# EasyEDA Pro project Programmable Gain Amplifier.eprj

# Schematic Schematic1
Board Name: Board1; Create Date: 2026-07-07; Page Name: P1; Project Name: Programmable Gain Amplifier; Schematic Name: Schematic1; Update Date: 2026-07-08; Company: 嘉立创EDA; Page Size: A4; Version: V1.0
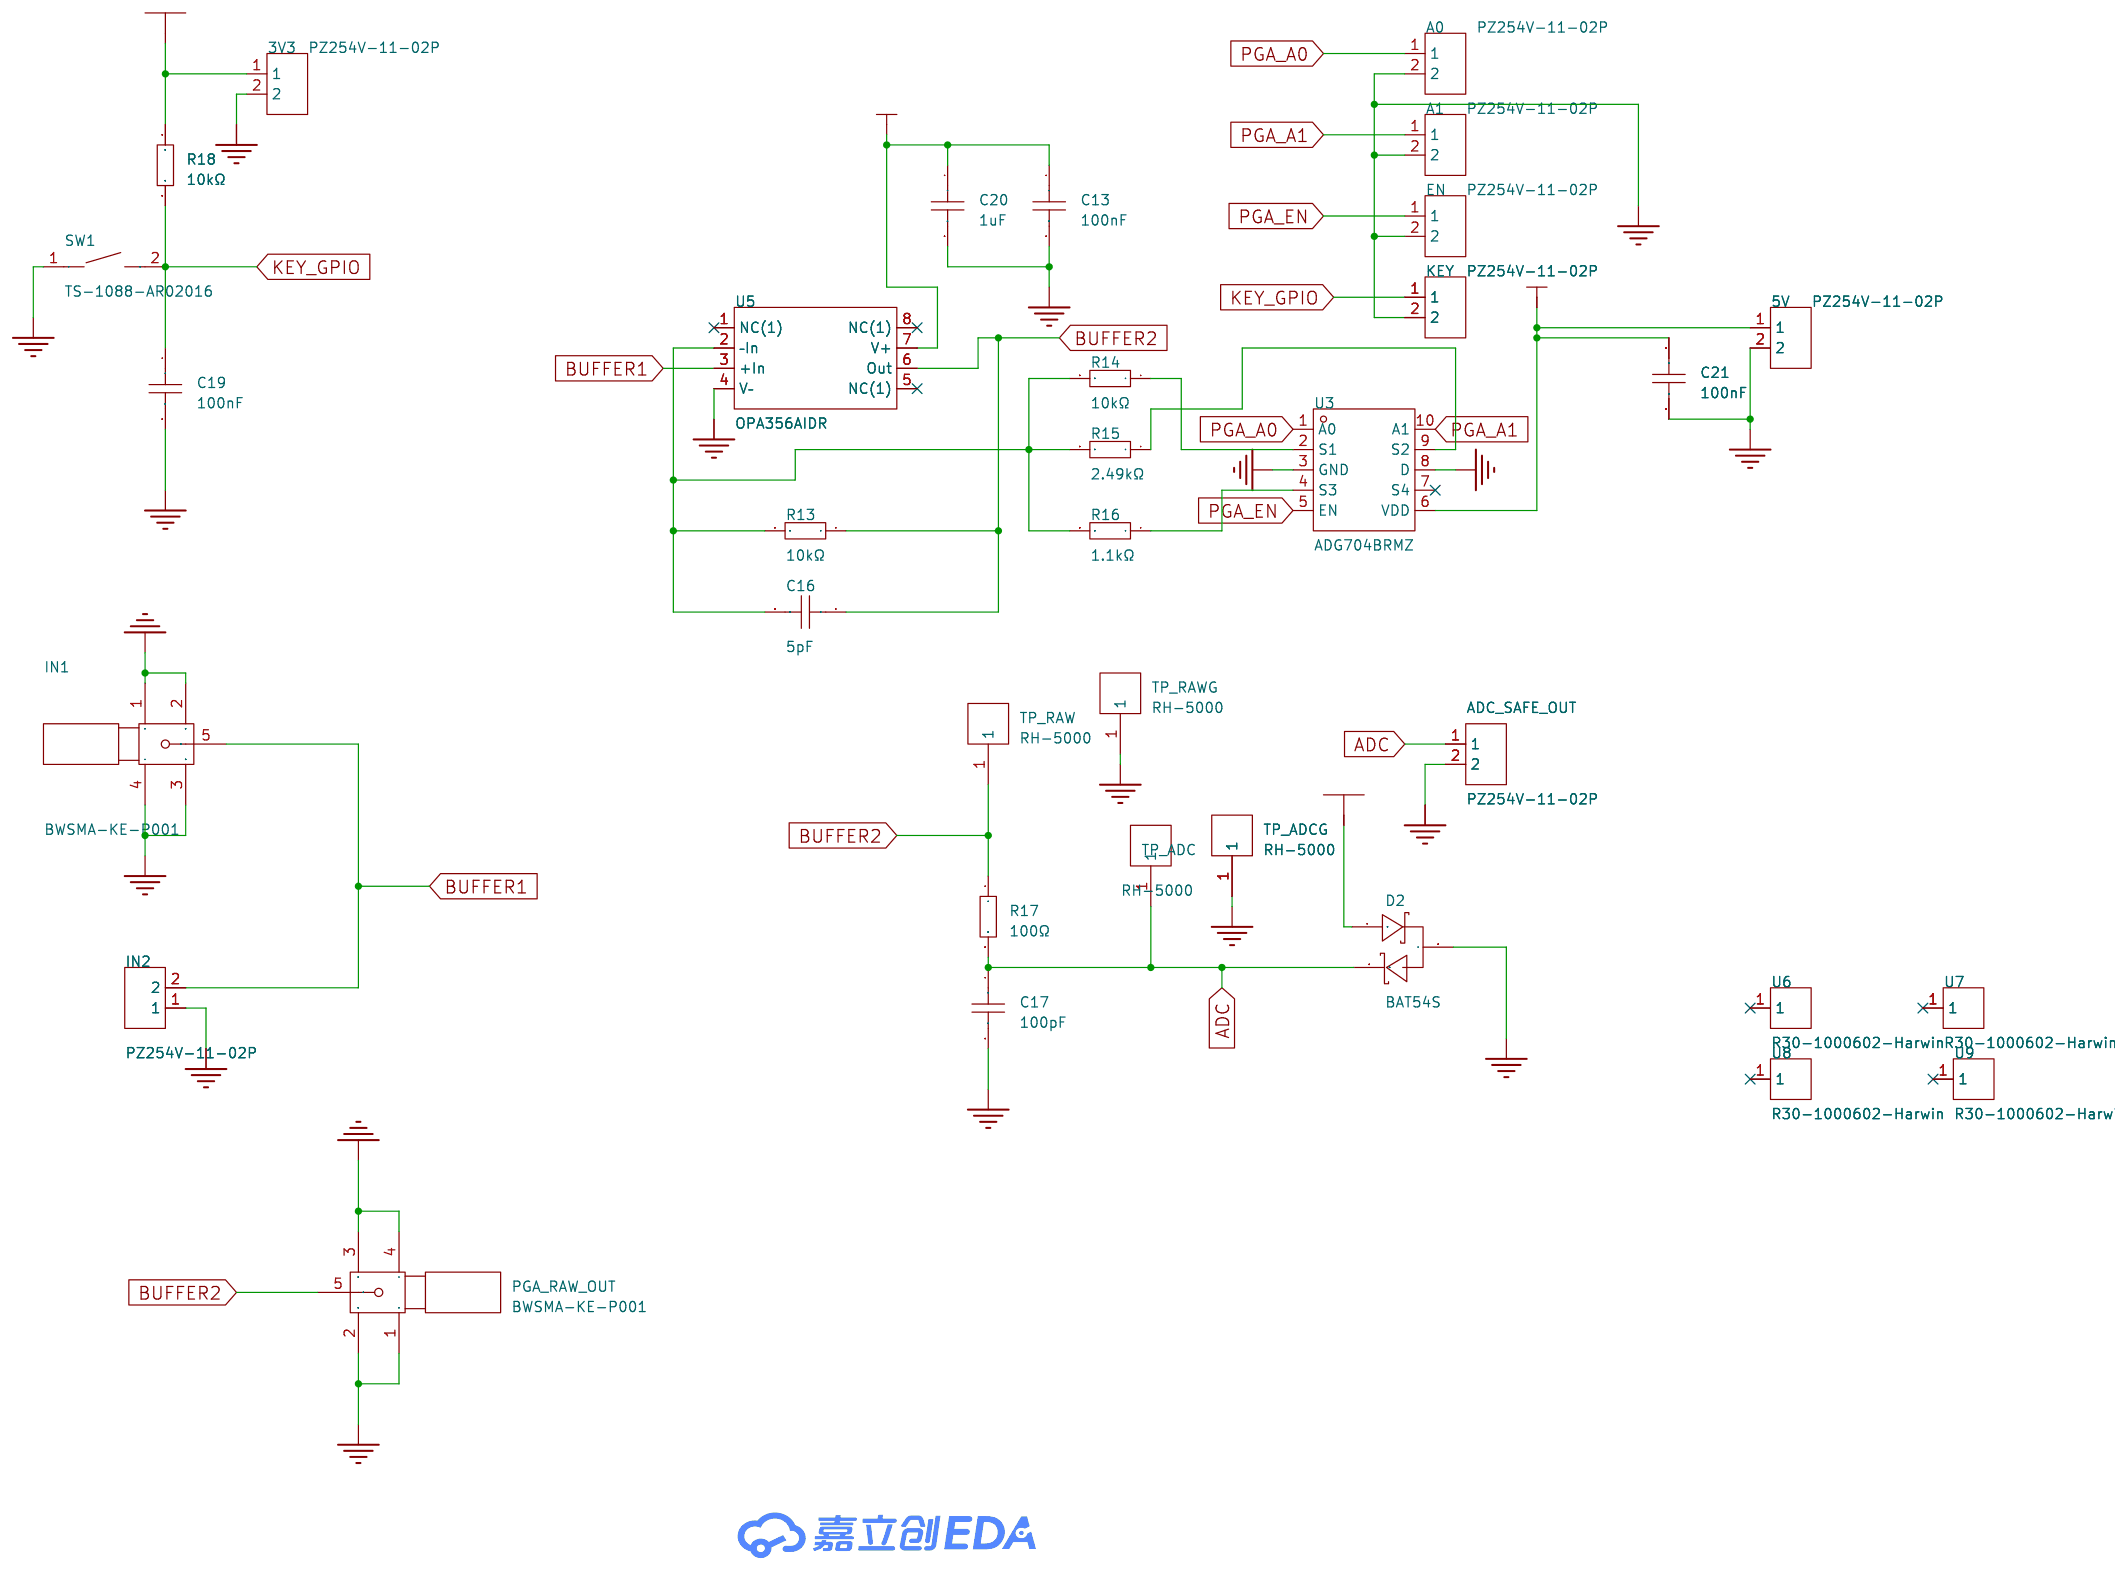
[diagram p0: schematic sheet]

## Parts
3V3  PZ254V-11-02P  [HDR-TH_2P-P2.54-V-M]
5V  PZ254V-11-02P  [HDR-TH_2P-P2.54-V-M]
A0  PZ254V-11-02P  [HDR-TH_2P-P2.54-V-M]
A1  PZ254V-11-02P  [HDR-TH_2P-P2.54-V-M]
ADC_SAFE_OUT  PZ254V-11-02P  [HDR-TH_2P-P2.54-V-M]
C13  100nF  [C0603]
C16  5pF  [C0603]
C17  100pF  [C0603]
C19  100nF  [C0603]
C20  1uF  [C0603]
C21  100nF  [C0603]
D2  BAT54S  [SOT-23-3_L2.9-W1.3-P1.90-LS2.4-BR]
EN  PZ254V-11-02P  [HDR-TH_2P-P2.54-V-M]
IN1  BWSMA-KE-P001  [SMA-SMD_BWSMA-KE-P001]
IN2  PZ254V-11-02P  [HDR-TH_2P-P2.54-V-M]
KEY  PZ254V-11-02P  [HDR-TH_2P-P2.54-V-M]
PGA_RAW_OUT  BWSMA-KE-P001  [SMA-SMD_BWSMA-KE-P001]
R13  10kΩ  [R0603]
R14  10kΩ  [R0603]
R15  2.49kΩ  [R0603]
R16  1.1kΩ  [R0603]
R17  100Ω  [R0805]
R18  10kΩ  [R0805]
SW1  TS-1088-AR02016  [SW-SMD_L3.9-W3.0-P4.45]
TP_ADC  RH-5000  [TEST-TH_BD2.54-P1.4_RED]
TP_ADCG  RH-5000  [TEST-TH_BD2.54-P1.4_RED]
TP_RAW  RH-5000  [TEST-TH_BD2.54-P1.4_RED]
TP_RAWG  RH-5000  [TEST-TH_BD2.54-P1.4_RED]
U3  ADG704BRMZ  [MSOP-10_L3.0-W3.0-P0.50-LS5.0-BL]
U5  OPA356AIDR  [SOIC-8_L4.9-W3.9-P1.27-LS6.0-BL]
U6  R30-1000602-Harwin  [SMD_BD5.0-D3.0]
U7  R30-1000602-Harwin  [SMD_BD5.0-D3.0]
U8  R30-1000602-Harwin  [SMD_BD5.0-D3.0]
U9  R30-1000602-Harwin  [SMD_BD5.0-D3.0]

## Library data of the parts
3V3 5V A0 A1 ADC_SAFE_OUT EN IN2 KEY = PZ254V-11-02P: 插针结构:1x2P;间距:2.54mm;行距:-;圆针/方针:方针;安装方式:直插;排数:单排;总PIN位数:2P;额定电流:-;额定电压:-;配合针长度:6mm;塑高:2.5mm;端接针长度:3mm;触头材质:黄铜;触头镀层:-;工作温度:-40℃~+105℃;颜色:黑色;; LCSC Part Name: 1x2P 间距:2.54mm 方针 直插; Supplier Part: C492401; Manufacturer: XFCN(兴飞); Supplier Footprint: 插件,P=2.54mm; JLCPCB Part Class: Extended Part; Datasheet: https://item.szlcsc.com/datasheet/PZ254V-11-02P/502957.html; Supplier: LCSC; Pin Structure: 1x2P; Pitch: 2.54mm; Circluar Pins/Square Pins: 方针; Mounting Type: 直插; Number of Rows: 单排; Number of Pins: 2P; Length of Mating Pin: 6mm; Insulation Height: 2.5mm; Length of End Connection Pin: 3mm; Contact Material: 黄铜; Operating Temperature: -40℃~+105℃; Color: 黑色
C13 C19 C21 = CC0603KRX7R9BB104: 容值:100nF;精度:±10%;额定电压:50V;温度系数:X7R;; LCSC Part Name: 100nF ±10% 50V; Supplier Part: C14663; Manufacturer: YAGEO(国巨); Supplier Footprint: 0603; JLCPCB Part Class: Basic Part; Datasheet: https://item.szlcsc.com/datasheet/CC0603KRX7R9BB104/15331.html; Supplier: LCSC; Tolerance: ±10%; Voltage Rating: 50V; Temperature Coefficient: X7R
C16 = FCC0603N5R0C500CT: 容值:5pF;额定电压:50V;温度系数:C0G;; LCSC Part Name: ±0.25pF 5pF 50V; Supplier Part: C5137626; Manufacturer: FOJAN(富捷); Supplier Footprint: 0603; JLCPCB Part Class: Extended Part; Datasheet: https://item.szlcsc.com/datasheet/FCC0603N5R0C500CT/5747078.html; Supplier: LCSC; Voltage Rating: 50V; Temperature Coefficient: C0G
C17 = CL10C101JB8NNNC: 容值:100pF;精度:±5%;额定电压:50V;温度系数:C0G;; LCSC Part Name: 100pF ±5% 50V; Supplier Part: C14858; Manufacturer: SAMSUNG(三星); Supplier Footprint: 0603; JLCPCB Part Class: Basic Part; Datasheet: https://item.szlcsc.com/datasheet/CL10C101JB8NNNC/15530.html; Supplier: LCSC; Tolerance: ±5%; Voltage Rating: 50V; Temperature Coefficient: C0G
C20 = CL10A105KB8NNNC: LCSC Part Name: 1uF ±10% 50V; Supplier Part: C15849; Manufacturer: SAMSUNG(三星); Supplier Footprint: 0603; JLCPCB Part Class: Basic Part; Datasheet: https://item.szlcsc.com/datasheet/CL10A105KB8NNNC/16531.html; Supplier: LCSC; Tolerance: ±10%; Voltage Rating: 50V; Temperature Coefficient: X5R
D2 = BAT54S_C7420333: 二极管配置:1对串联式;正向压降(Vf):400mV@10mA;直流反向耐压(Vr):30V;整流电流:200mA;; LCSC Part Name: 电压:30V 电流:200mA; Supplier Part: C7420333; Manufacturer: R+O(宏嘉诚); Supplier Footprint: SOT-23; JLCPCB Part Class: 扩展库; Datasheet: https://item.szlcsc.com/datasheet/BAT54S/8397155.html; Supplier: LCSC; Diode Configuration: 1对串联式; Voltage - Forward(Vf@If): 400mV@10mA; Voltage - DC Reverse(Vr): 30V; Current - Rectified: 200mA; Reverse Leakage Current (Ir): 2uA@30V; Non-Repetitive Peak Forward Surge Current: 600mA
IN1 PGA_RAW_OUT = BWSMA-KE-P001: 连接器类型:板端;射频系列:SMA;接口类型:内孔;端口数量:1;阻抗:-;频率-最大值:-;样式:偏脚;接口直径:5.2mm;接口长度/高度:-;工作温度范围:-;; LCSC Part Name: SMA 内孔 偏脚; Supplier Part: C496550; Manufacturer: BAT WIRELESS(蝙蝠无线); Supplier Footprint: 插件; JLCPCB Part Class: Extended Part; Datasheet: https://atta.szlcsc.com/upload/public/pdf/source/20200416/C496550_06668BF2E3B968EA39F96D17E7156373.pdf; Supplier: LCSC; Connector Type: 板端; RF Series: SMA; Interface Type: 内孔; Number of Ports: 1; Style: 偏脚; Interface Diameter: 5.2mm
R13 R14 = RT0603BRD0710KL: 电阻类型:薄膜电阻;阻值:10kΩ;精度:±0.1%;功率:100mW;工作电压:75V;温度系数:±25ppm/℃;; LCSC Part Name: 薄膜电阻 10kΩ ±0.1% 100mW; Supplier Part: C95204; Manufacturer: YAGEO(国巨); Supplier Footprint: 0603; JLCPCB Part Class: Extended Part; Datasheet: https://item.szlcsc.com/datasheet/RT0603BRD0710KL/96405.html; Supplier: LCSC; Type: 薄膜电阻; Tolerance: ±0.1%; Power(Watts): 100mW; Voltage-Supply(Max): 75V; Temperature Coefficient: ±25ppm/℃; Operating Temperature: -55℃~+155℃
R15 = RT0603BRE072K49L: 电阻类型:薄膜电阻;阻值:2.49kΩ;精度:±0.1%;功率:100mW;工作电压:75V;温度系数:±50ppm/℃;; LCSC Part Name: 薄膜电阻 2.49kΩ ±0.1% 100mW; Supplier Part: C705842; Manufacturer: YAGEO(国巨); Supplier Footprint: 0603; JLCPCB Part Class: Extended Part; Datasheet: https://item.szlcsc.com/datasheet/RT0603BRE072K49L/742362.html; Supplier: LCSC; Type: 薄膜电阻; Tolerance: ±0.1%; Power(Watts): 100mW; Voltage-Supply(Max): 75V; Temperature Coefficient: ±50ppm/℃; Operating Temperature: -55℃~+155℃
R16 = ERA3AEB112V: 电阻类型:薄膜电阻;阻值:1.1kΩ;精度:±0.1%;功率:100mW;工作电压:75V;温度系数:±25ppm/℃;; LCSC Part Name: 1.1kΩ ±0.1% 100mW 薄膜电阻; Supplier Part: C543640; Manufacturer: PANASONIC(松下); Supplier Footprint: 0603; JLCPCB Part Class: Extended Part; Datasheet: https://item.szlcsc.com/datasheet/ERA3AEB112V/564276.html; Supplier: LCSC; Type: 薄膜电阻; Tolerance: ±0.1%; Power(Watts): 100mW; Voltage-Supply(Max): 75V; Temperature Coefficient: ±25ppm/℃; Operating Temperature: -55℃~+155℃
R17 = 0805W8F1000T5E: 电阻类型:厚膜电阻;阻值:100Ω;精度:±1%;功率:125mW;最大工作电压:150V;温度系数:±100ppm/℃;; LCSC Part Name: 100Ω ±1% 125mW 厚膜电阻; Supplier Part: C17408; Manufacturer: UNI-ROYAL(厚声); Supplier Footprint: 0805; JLCPCB Part Class: Basic Part; Datasheet: https://atta.szlcsc.com/upload/public/pdf/source/20200306/C422600_1E6D84923E4A46A82E41ADD87F860B5C.pdf; Supplier: LCSC; Type: 厚膜电阻; Tolerance: ±1%; Power(Watts): 125mW; Overload Voltage (Max): 150V; Temperature Coefficient: ±100ppm/℃; Operating Temperature Range: -55℃~+155℃
R18 = 0805W8F1002T5E_C17414: 电阻类型:厚膜电阻;阻值:10kΩ;精度:±1%;功率:125mW;工作电压:150V;温度系数:±100ppm/℃;; LCSC Part Name: 10kΩ ±1% 125mW 厚膜电阻; Supplier Part: C17414; Manufacturer: UNI-ROYAL(厚声); Manufacturer Part: 0805W8F1002T5E; Supplier Footprint: 0805; JLCPCB Part Class: Basic Part; Datasheet: https://item.szlcsc.com/datasheet/0805W8F1002T5E/18102.html; Supplier: LCSC; Type: 厚膜电阻; Tolerance: ±1%; Power(Watts): 125mW; Voltage-Supply(Max): 150V; Temperature Coefficient: ±100ppm/℃; Operating Temperature: -55℃~+155℃
SW1 = TS-1088-AR02016: 电路结构:单刀单掷;按钮形状:圆形按钮;作用力:1.6N;安装方式:立贴;开关长度:3.9mm;开关宽度:3mm;开关高度:2mm;带支架:不带支架;触点电流:50mA;额定电压:12V;带灯:-;工作寿命:10万次;; LCSC Part Name: 3.9*3*2mm 立贴 轻触开关; Supplier Part: C720477; Manufacturer: XUNPU(讯普); Supplier Footprint: SMD,4x3mm; JLCPCB Part Class: 基础库; Datasheet: https://item.szlcsc.com/datasheet/TS-1088-AR02016/763484.html; Supplier: LCSC; Circuit: 单刀单掷; Actuator Style: 圆形按钮; Operating Force: 1.6N; Mounting Type: 立贴; Length: 3.9mm; Width: 3mm; Switch Height: 2mm; with Bracket: 不带支架; Contact Current: 50mA; Voltage Rating: 12V; Actuator/Cap Color: 黑色; Termination Style: SMD接片; Life: 10万次; Operating Temperature: -30℃~+80℃
TP_ADC TP_ADCG TP_RAW TP_RAWG = RH-5000: LCSC Part Name: PCB电路板测试点/测试针; Supplier Part: C5277086; Manufacturer: 荣和; JLCPCB Part Class: 扩展库; Datasheet: https://item.szlcsc.com/datasheet/RH-5000/6009931.html; Supplier: LCSC; Connector Type: 插针型(穿板); Plastic Color: 红色; Board Space (Diameter φ/ Length x Width): 2.5mm
U3 = ADG704BRMZ: 开关电路:4:1;通道数:1;导通电阻(Ron):4.5Ω;; LCSC Part Name: 低电压4欧姆,4通道多路复用器; Supplier Part: C579087; Manufacturer: ADI(亚德诺); Supplier Footprint: MSOP-10; JLCPCB Part Class: 扩展库; Datasheet: https://item.szlcsc.com/datasheet/ADG704BRMZ/606864.html; Supplier: LCSC; Switch Circuit: 4:1; Number of Channels: 1; Ron: 4.5Ω; Voltage - Supply: 1.8V~5.5V; Con: 54pF; Turn-on time: 20ns; Turn-off time: 13ns; Bandwidth: 200MHz; Operating Temperature: -40℃~+85℃; Features: 双向模拟通道；无毛刺切换
U5 = OPA356AIDR: 放大器数:1;轨到轨:轨到轨输出;增益带宽积(GBW):200MHz;输入失调电压(Vos):2mV;压摆率(SR):360V/us;输入偏置电流(Ib):3pA;; LCSC Part Name: 200MHz, CMOS 运算放大器; Supplier Part: C2059381; Manufacturer: TI(德州仪器); Supplier Footprint: SOIC-8; JLCPCB Part Class: Extended Part; Datasheet: https://www.ti.com/cn/lit/gpn/opa356; Supplier: LCSC; Number of Channels: 1; Maximum Power Supply Range (Vdd-Vss): 5.5V; Rail to Rail: 轨到轨输出; Gain Bandwidth Product: 200MHz; Vos - Input Offset Voltage: 2mV; Input Offset Voltage Drift(Vos TC): 7uV/℃; Slew Rate: 360V/us; Ib - Input Bias Current: 3pA; Input Offset Current(Ios): 1pA; Input Voltage Noise Density: 5.8nV/√Hz@1MHz; Common Mode Rejection Ratio(CMRR): 80dB; Quiescent Current: 8.3mA; Output Current: 60mA; Operating Temperature: -40℃~+125℃; Single supply: 2.5V~5.5V; Dual Supply: -2.75V~-1.25V；1.25V~2.75V; Features: 内置补偿；ESD保护
U6-U9 = R30-1000602-Harwin: LCSC Part Name: HARWIN M3 x 0.5六角黄铜螺母柱,6mm总长,5mm六角对边, R30-1000602 rs1613559; Supplier Part: C47018769; Manufacturer: Harwin; JLCPCB Part Class: 扩展库; Datasheet: https://item.szlcsc.com/datasheet/R30-1000602-Harwin/49200836.html; Supplier: LCSC

## Nets
3V3: 3V3.1 D2.1(K1) R18.1
5V: 5V.1 C13.1 C20.1 C21.1 U3.6(VDD) U5.7(V+)
GND: 3V3.2 5V.2 A0.2 A1.2 ADC_SAFE_OUT.2 C13.2 C17.2 C19.2 C20.2 C21.2 D2.3(A) EN.2 IN1.1 IN1.2 IN1.3 IN1.4 IN2.1 KEY.2 PGA_RAW_OUT.1 PGA_RAW_OUT.2 PGA_RAW_OUT.3 PGA_RAW_OUT.4 SW1.1 TP_ADCG.1 TP_RAWG.1 U3.3(GND) U3.8(D) U5.4(V–)
ADC: ADC_SAFE_OUT.1 C17.1 D2.2(K2) R17.2 TP_ADC.1
BUFFER1: IN1.5 IN2.2 U5.3(+In)
BUFFER2: C16.1 PGA_RAW_OUT.5 R13.1 R17.1 TP_RAW.1 U5.6(Out)
KEY_GPIO: C19.1 KEY.1 R18.2 SW1.2
PGA_A0: A0.1 U3.1(A0)
PGA_A1: A1.1 U3.10(A1)
PGA_EN: EN.1 U3.5(EN)
$1N916: R14.1 U3.2(S1)
$1N917: R15.1 U3.9(S2)
$1N918: R16.1 U3.4(S3)
$1N929: C16.2 R13.2 R14.2 R15.2 R16.2 U5.2(–In)

Not connected (* = marked no-connect by the designer): U3 7(S4)*; U5 1(NC(1))* 5(NC(1))* 8(NC(1))*; U6 1*; U7 1*; U8 1*; U9 1*

# Board PCB1
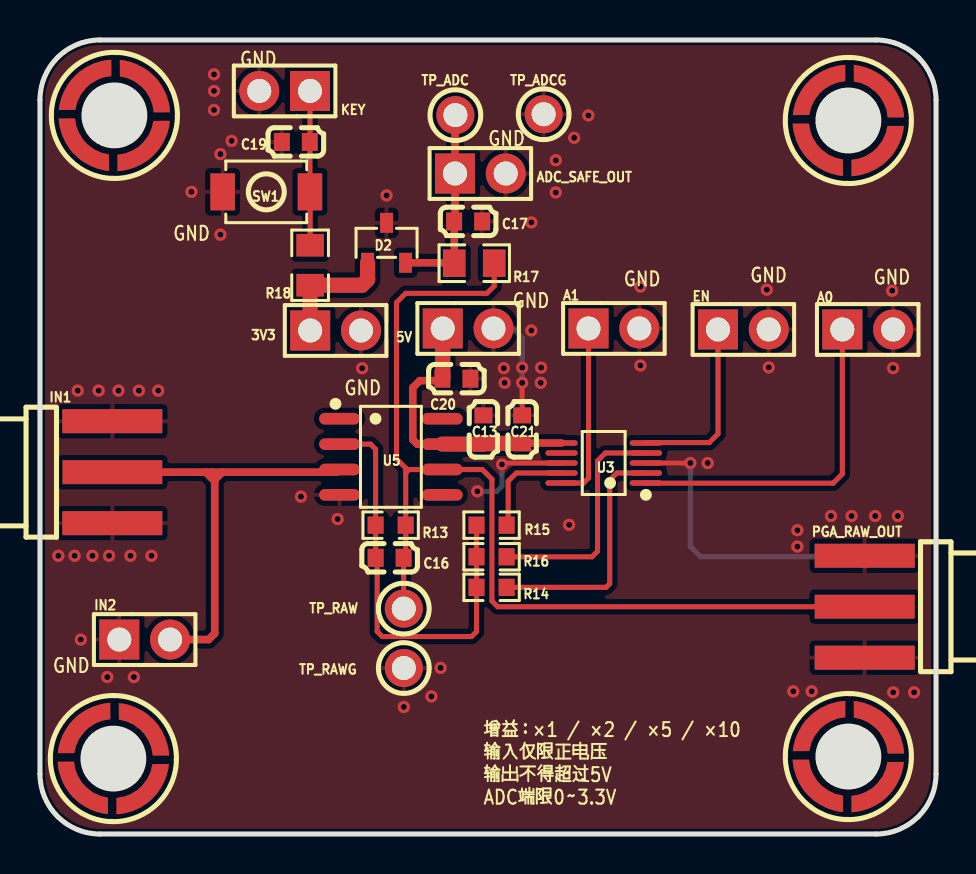
[diagram p1: board, top side]
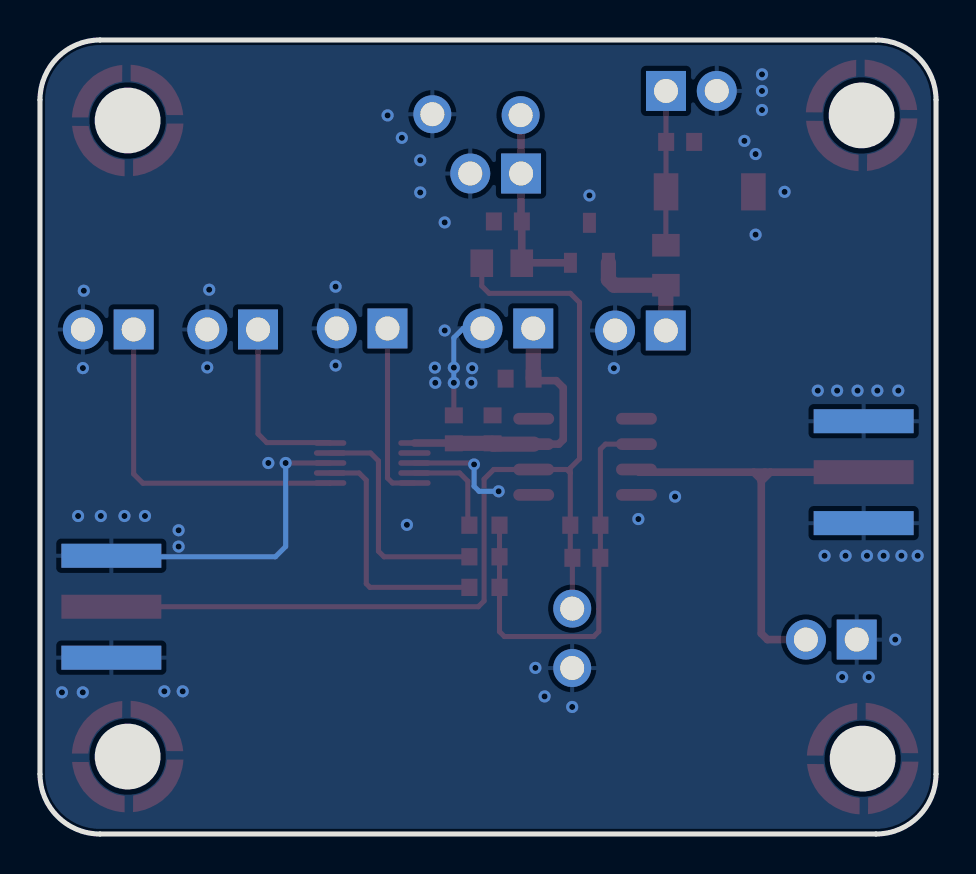
[diagram p2: board, bottom side, seen from below]

Outline 44.83 x 39.73 mm; copper layers: Top Layer, Bottom Layer. Coordinates in mm from the lower left corner of the outline.
Outline path: 0,36.73 0,3 arc(0.88,0.88) 3,0 41.83,0 arc(43.95,0.88) 44.83,3 44.83,36.73 arc(43.95,38.85) 41.83,39.73 3,39.73 arc(0.88,38.85) 0,36.73
Stack: Top Layer 0.035mm / Dielectric1 1.51mm FR4 er 4.5 / Bottom Layer 0.035mm

## Design rules (mm)
template: JLCPCB Capability(Two Layers Board)
spacing copperThickness1oz (default): track to track 0.102, other pairs 0.152 to 0.3
spacing copperThickness2oz: track to track 0.203, other pairs 0.152 to 0.3
track width copperThickness1oz (default): min 0.127, default 0.254, max 2.54
track width copperThickness2oz: min 0.203, default 0.254, max 2.54
differential pair differentialPair (default): width min 0.127, default 0.254, max 2.54; gap min 0.152, default 0.152
via viaSize (default): diameter min 0.5, default 0.61, max 10; hole min 0.3, default 0.305, max 6.3

## Placement (name value [footprint] x y rotation side)
3V3  PZ254V-11-02P  [HDR-TH_2P-P2.54-V-M]  14.79 25.19 0 top
5V  PZ254V-11-02P  [HDR-TH_2P-P2.54-V-M]  21.42 25.3 0 top
A0  PZ254V-11-02P  [HDR-TH_2P-P2.54-V-M]  41.41 25.24 0 top
A1  PZ254V-11-02P  [HDR-TH_2P-P2.54-V-M]  28.71 25.3 0 top
ADC_SAFE_OUT  PZ254V-11-02P  [HDR-TH_2P-P2.54-V-M]  22.03 33.05 0 top
C13  100nF  [C0603]  22.19 20.25 90 top
C16  5pF  [C0603]  17.49 13.82 180 top
C17  100pF  [C0603]  21.42 30.65 0 top
C19  100nF  [C0603]  12.8 34.63 180 top
C20  1uF  [C0603]  20.83 22.78 0 top
C21  100nF  [C0603]  24.12 20.25 90 top
D2  BAT54S  [SOT-23-3_L2.9-W1.3-P1.90-LS2.4-BR]  17.34 29.58 270 top
EN  PZ254V-11-02P  [HDR-TH_2P-P2.54-V-M]  35.19 25.24 0 top
IN1  BWSMA-KE-P001  [SMA-SMD_BWSMA-KE-P001]  3.62 18.1 180 top
IN2  PZ254V-11-02P  [HDR-TH_2P-P2.54-V-M]  5.24 9.73 0 top
KEY  PZ254V-11-02P  [HDR-TH_2P-P2.54-V-M]  12.24 37.18 180 top
PGA_RAW_OUT  BWSMA-KE-P001  [SMA-SMD_BWSMA-KE-P001]  41.26 11.37 0 top
R13  10kΩ  [R0603]  17.54 15.45 180 top
R14  10kΩ  [R0603]  22.59 12.34 180 top
R15  2.49kΩ  [R0603]  22.59 15.45 180 top
R16  1.1kΩ  [R0603]  22.59 13.87 180 top
R17  100Ω  [R0805]  21.73 28.56 180 top
R18  10kΩ  [R0805]  13.51 28.46 90 top
SW1  TS-1088-AR02016  [SW-SMD_L3.9-W3.0-P4.45]  11.32 32.13 0 top
TP_ADC  RH-5000  [TEST-TH_BD2.54-P1.4_RED]  20.78 35.97 0 top
TP_ADCG  RH-5000  [TEST-TH_BD2.54-P1.4_RED]  25.2 36.01 0 top
TP_RAW  RH-5000  [TEST-TH_BD2.54-P1.4_RED]  18.2 11.28 0 top
TP_RAWG  RH-5000  [TEST-TH_BD2.54-P1.4_RED]  18.2 8.31 0 top
U3  ADG704BRMZ  [MSOP-10_L3.0-W3.0-P0.50-LS5.0-BL]  28.2 18.56 90 top
U5  OPA356AIDR  [SOIC-8_L4.9-W3.9-P1.27-LS6.0-BL]  17.56 18.87 270 top
U6  R30-1000602-Harwin  [SMD_BD5.0-D3.0]  3.72 35.96 0 top
U7  R30-1000602-Harwin  [SMD_BD5.0-D3.0]  3.67 3.77 0 top
U8  R30-1000602-Harwin  [SMD_BD5.0-D3.0]  40.44 35.7 0 top
U9  R30-1000602-Harwin  [SMD_BD5.0-D3.0]  40.44 3.88 0 top

## Footprints (pads in the part's own frame, mm; a bottom-side part is the same pattern mirrored in y, then rotated)
C0603
  rect 0.8x0.9 smd: 1(-0.7,0) 2(0.7,0)
HDR-TH_2P-P2.54-V-M
  rect 2x2 hole 1.2: 1(-1.27,0)
  round 2 hole 1.2: 2(1.27,0)
MSOP-10_L3.0-W3.0-P0.50-LS5.0-BL
  oval 0.28x1.62 smd: 1(-1,-2.11) 2(-0.5,-2.11) 3(0,-2.11) 4(0.5,-2.11) 5(1,-2.11) 6(1,2.11) 7(0.5,2.11) 8(0,2.11) 9(-0.5,2.11) 10(-1,2.11)
R0603
  rect 0.806x0.864 smd: 1(-0.753,0) 2(0.753,0)
R0805
  rect 1.133x1.377 smd: 1(-1,0) 2(1,0)
SMA-SMD_BWSMA-KE-P001
  rect 5x1.2 smd: 1(0,-2.55) 2(0,2.55) 5(0,0)
  rect 5x1.2 smd far side: 3(0,2.55) 4(0,-2.55)
SMD_BD5.0-D3.0
  custom 2.52x2.628 smd: 1(-1.529,-1.792) 1(1.529,1.792)
  custom 2.629x2.52 smd: 1(-1.466,1.847) 1(1.465,-1.847)
SOIC-8_L4.9-W3.9-P1.27-LS6.0-BL
  oval 0.588x2.045 smd: 1(-1.905,-2.57) 2(-0.635,-2.57) 3(0.635,-2.57) 4(1.905,-2.57) 5(1.905,2.57) 6(0.635,2.57) 7(-0.635,2.57) 8(-1.905,2.57)
SOT-23-3_L2.9-W1.3-P1.90-LS2.4-BR
  rect 1x0.65 smd: 1(1,-0.95) 2(1,0.95) 3(-1,0)
SW-SMD_L3.9-W3.0-P4.45
  rect 1.23x1.86 smd: 1(-2.185,0) 2(2.185,0)
TEST-TH_BD2.54-P1.4_RED
  round 1.9 hole 1.2: 1(0,0)

## Nets
As in the schematic.

Pads without a net: U3 7; U5 1 5 8; U6 1; U7 1; U8 1; U9 1

## Via types
v1: diameter 0.61, hole 0.305, Top Layer to Bottom Layer, 60 vias
v2: diameter 0.6, hole 0.3, Top Layer to Bottom Layer, 1 via

## Routing (per net, layer and track width the routed paths; a pad name or vN(x,y) marks a point on that pad's centre or on a via; arc(x,y) is an arc through that point)
3V3: length 6.1
  Top Layer w0.762: D2.1 16.39,27.74 16.11,27.46 R18.1 13.52,27.45 3V3.1
5V: length 14.2
  Top Layer w0.381: U3.6 24.14,19.56 C21.1 ; 20.13,19.51 18.88,19.51 18.65,19.73 18.65,22.33 19,22.68 20.03,22.68
  Top Layer w0.762: C21.1 C13.1 22.15,19.51 20.13,19.51 ; 5V.1 20.15,22.8 C20.1
GND: length 26.3
  Top Layer w0.254: U3.8 23.18,18.56 v2(23.11,18.49) ; U3.3 v1(32.54,18.56) ; v1(24.12,22.58) C21.2
  Bottom Layer w0.254: PGA_RAW_OUT.2 41.21,13.87 33.05,13.87 32.54,14.38 v1(32.54,18.56) ; v2(23.11,18.49) 23.11,17.4 22.86,17.15 v1(21.88,17.15) ; v1(24.12,22.58) v1(24.12,23.34) 24.12,24.83 23.66,25.3 5V.2
  vias: v1(0.92,13.92) v1(1.73,13.92) v1(1.89,22.18) v1(2.04,9.73) v1(2.62,13.92) v1(2.94,22.18) v1(3.37,7.85) v1(3.46,13.92) v1(3.93,22.18) v1(4.53,13.92) v1(4.7,7.85) v1(4.95,22.18) v1(5.58,13.92) v1(5.92,22.18) v1(7.58,32.13) v1(8.71,38.01) v1(8.71,37.18) v1(8.71,36.23) v1(9.03,34.02) v1(9.03,29.99) v1(9.59,34.68) v1(13.06,16.88) v1(14.89,15.76) v1(16.12,23.31) v1(17.34,31.95) v1(18.2,6.36) v1(19.58,6.88) v1(20.04,8.31) v1(23.21,23.31) v1(23.25,22.58) v1(24.58,30.6) v1(24.58,25.19) v1(25.07,23.34) v1(25.05,22.58) v1(25.81,33.71) v1(25.81,32.1) v1(26.47,15.47) v1(26.72,34.83) v1(27.44,35.96) v1(30.04,27.39) v1(30.04,23.44) v1(33.41,18.56) v1(36.36,27.23) v1(36.46,23.35) v1(37.69,7.14) v1(37.89,15.2) v1(37.89,14.38) v1(38.61,7.14) v1(39.58,15.91) v1(40.6,15.91) v1(41.79,15.91) v1(42.64,27.18) v1(42.68,23.31) v1(42.69,7.09) v1(42.92,15.91) v1(43.73,7.09)
ADC: length 9.9
  Top Layer w0.381: TP_ADC.1 20.76,35.95 ADC_SAFE_OUT.1 20.76,30.69 C17.1 20.73,30.65 R17.2 20.71,28.58 D2.2
BUFFER1: length 23.1
  Top Layer w0.381: IN1.5 8.29,18.1 ; 8.29,18.1 8.56,18.1 ; 8.29,18.1 8.74,17.65 ; 8.74,17.73 8.74,17.65 ; 8.74,17.73 9.12,18.1 ; 8.74,17.73 8.74,17.93 8.56,18.1 ; 8.74,17.65 8.74,10.03 8.44,9.73 IN2.2 ; 8.56,18.1 9.12,18.1 ; 9.12,18.1 14.85,18.1 U5.3
BUFFER2: length 51.4
  Top Layer w0.254: 18.3,18.06 18.47,18.24 22.13,18.24 22.61,17.76 22.61,11.66 22.9,11.37 PGA_RAW_OUT.5 ; 18.3,18.06 18.3,18.31 17.84,18.77 17.84,26.59 18.29,27.05 22.36,27.05 22.73,27.42 R17.1 ; 18.3,18.06 R13.1 18.3,13.93 C16.1 18.19,11.29 TP_RAW.1
KEY_GPIO: length 7.7
  Top Layer w0.254: R18.2 13.51,32.12 SW1.2 13.51,34.62 C19.1 13.51,34.64 KEY.1
PGA_A0: length 17.3
  Top Layer w0.254: U3.1 30.32,17.55 39.68,17.55 40.14,18.02 A0.1
PGA_A1: length 8.9
  Top Layer w0.254: U3.10 27.19,17.56 27.44,17.81 A1.1
PGA_EN: length 9
  Top Layer w0.254: EN.1 33.92,20.02 33.48,19.58 30.33,19.58 U3.5
$1N916: length 12.4
  Top Layer w0.254: U3.2 28.86,18.06 28.5,17.7 28.5,12.52 28.32,12.34 23.35,12.34
$1N917: length 5.1
  Top Layer w0.254: U3.9 23.83,18.06 23.42,17.65 23.42,15.53 23.35,15.45
$1N918: length 11.8
  Top Layer w0.254: U3.4 28.29,19.06 27.9,18.67 27.9,14.15 27.62,13.87 23.35,13.87
$1N929: length 21.6
  Top Layer w0.254: R15.2 R16.2 R14.2 21.84,10.13 21.6,9.88 17.12,9.88 16.87,10.14 16.87,13.74 C16.2 16.79,13.82 16.79,19.25 16.54,19.51 U5.2

## Copper pours and planes (outline as drawn; the poured copper is in the pictures)
GND on Top Layer: -1.62,40.41 46.08,40.41 46.08,-1.24 -1.62,-1.24
GND on Bottom Layer: -4.36,41.63 47.91,41.63 47.91,-6.37 -4.36,-6.37

## Text on the board
Top Silkscreen Layer: GND | 增益：×1 / ×2 / ×5 / ×10 / 输入仅限正电压 / 输出不得超过5V / ADC端限0～3.3V
